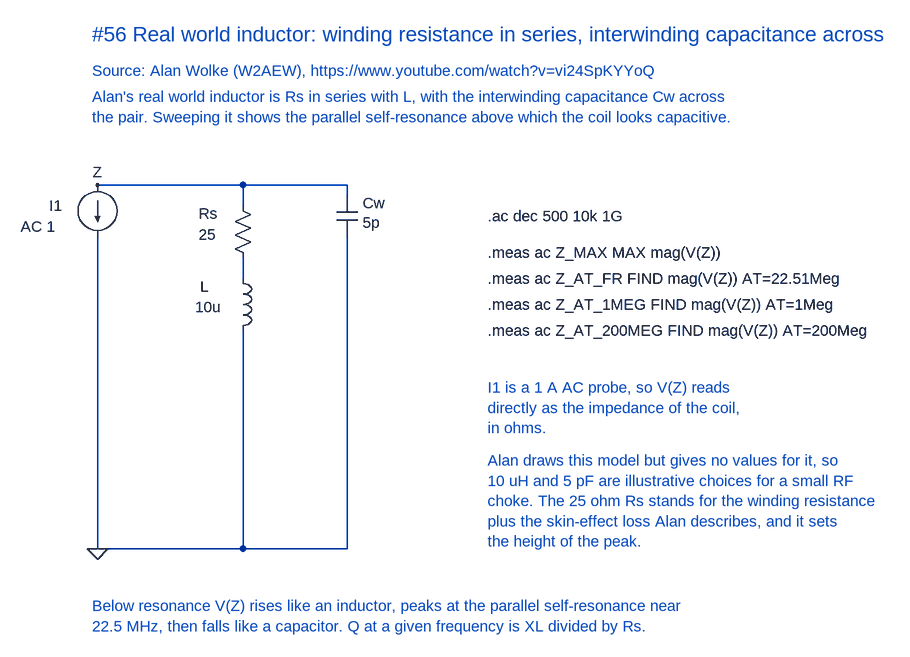
[diagram p0: schematic Real world inductor.asc]
Real world inductor.asc, the LTspice schematic file:
Version 4.1
SHEET 1 1600 1100
WIRE 256 0 480 0
WIRE 480 0 640 0
WIRE 256 80 256 560
WIRE 480 0 480 32
WIRE 480 112 480 144
WIRE 480 224 480 560
WIRE 640 0 640 16
WIRE 640 80 640 560
WIRE 256 560 480 560
WIRE 480 560 640 560
FLAG 256 0 Z
FLAG 256 560 0
SYMBOL current 256 0 R0
WINDOW 0 -74 32 Left 2
WINDOW 3 -118 64 Left 2
SYMATTR InstName I1
SYMATTR Value AC 1
SYMBOL res 464 16 R0
WINDOW 0 -52 28 Left 2
WINDOW 3 -52 60 Left 2
SYMATTR InstName Rs
SYMATTR Value 25
SYMBOL ind 464 128 R0
WINDOW 0 -50 28 Left 2
WINDOW 3 -58 60 Left 2
SYMATTR InstName L
SYMATTR Value 10u
SYMBOL cap 624 16 R0
WINDOW 0 40 12 Left 2
WINDOW 3 40 42 Left 2
SYMATTR InstName Cw
SYMATTR Value 5p
TEXT 248 -232 Left 3 ;#56 Real world inductor: winding resistance in series, interwinding capacitance across
TEXT 248 -176 Left 2 ;Source: Alan Wolke (W2AEW), https://www.youtube.com/watch?v=vi24SpKYYoQ
TEXT 248 -136 Left 2 ;Alan's real world inductor is Rs in series with L, with the interwinding capacitance Cw across\nthe pair. Sweeping it shows the parallel self-resonance above which the coil looks capacitive.
TEXT 856 48 Left 2 !.ac dec 500 10k 1G
TEXT 856 104 Left 2 !.meas ac Z_MAX MAX mag(V(Z))
TEXT 856 144 Left 2 !.meas ac Z_AT_FR FIND mag(V(Z)) AT=22.51Meg
TEXT 856 184 Left 2 !.meas ac Z_AT_1MEG FIND mag(V(Z)) AT=1Meg
TEXT 856 224 Left 2 !.meas ac Z_AT_200MEG FIND mag(V(Z)) AT=200Meg
TEXT 856 312 Left 2 ;I1 is a 1 A AC probe, so V(Z) reads\ndirectly as the impedance of the coil,\nin ohms.
TEXT 856 424 Left 2 ;Alan draws this model but gives no values for it, so\n10 uH and 5 pF are illustrative choices for a small RF\nchoke. The 25 ohm Rs stands for the winding resistance\nplus the skin-effect loss Alan describes, and it sets\nthe height of the peak.
TEXT 248 648 Left 2 ;Below resonance V(Z) rises like an inductor, peaks at the parallel self-resonance near\n22.5 MHz, then falls like a capacitor. Q at a given frequency is XL divided by Rs.

The netlist it stands for:
* Real world inductor.asc
I1 Z 0 AC 1
Rs Z N001 25
L N001 0 10u
Cw Z 0 5p
* #56 Real world inductor: winding resistance in series, interwinding capacitance across
* Source: Alan Wolke (W2AEW), https://www.youtube.com/watch?v=vi24SpKYYoQ
* Alan's real world inductor is Rs in series with L, with the interwinding capacitance Cw across
* the pair. Sweeping it shows the parallel self-resonance above which the coil looks capacitive.
.ac dec 500 10k 1G
.meas ac Z_MAX MAX mag(V(Z))
.meas ac Z_AT_FR FIND mag(V(Z)) AT=22.51Meg
.meas ac Z_AT_1MEG FIND mag(V(Z)) AT=1Meg
.meas ac Z_AT_200MEG FIND mag(V(Z)) AT=200Meg
* I1 is a 1 A AC probe, so V(Z) reads
* directly as the impedance of the coil,
* in ohms.
* Alan draws this model but gives no values for it, so
* 10 uH and 5 pF are illustrative choices for a small RF
* choke. The 25 ohm Rs stands for the winding resistance
* plus the skin-effect loss Alan describes, and it sets
* the height of the peak.
* Below resonance V(Z) rises like an inductor, peaks at the parallel self-resonance near
* 22.5 MHz, then falls like a capacitor. Q at a given frequency is XL divided by Rs.
.backanno
.end